# Altium schematic sheet Calendar.SchDoc: =DT_SCH_Title
size A4; Organization: Droid Technologies; SheetNumber: 18; SheetTotal: 22
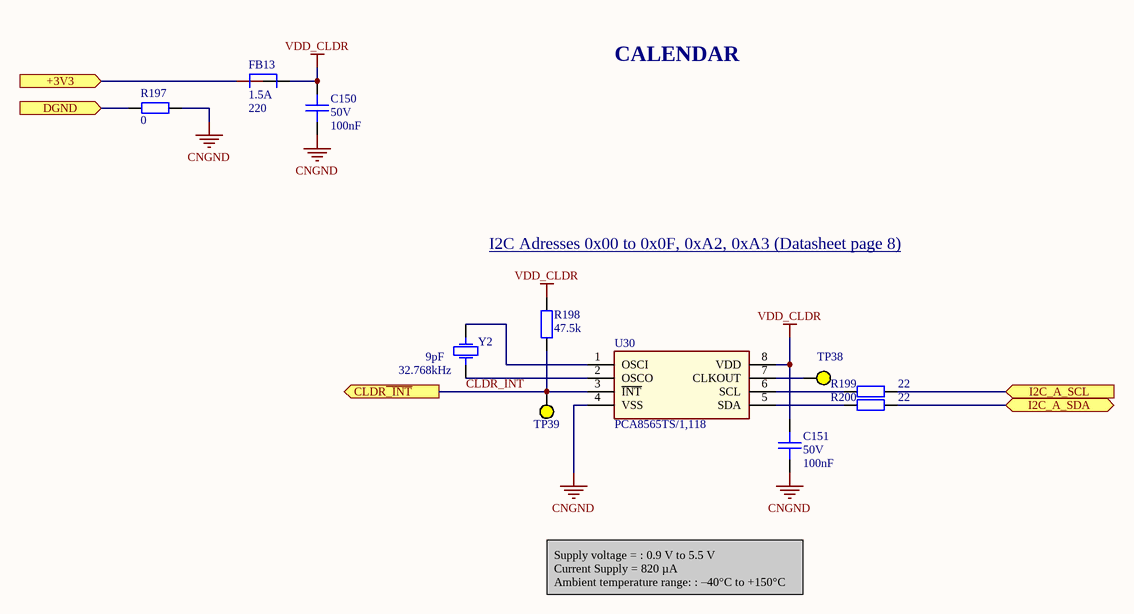
[diagram p0: Calendar.SchDoc]

## Parts
C150  Voltage Rating: 50V  Capacitance: 100nF  [CAPC100x50x50L25]  (hidden comment: GCM155L8EH104KE07D)
C151  Voltage Rating: 50V  Capacitance: 100nF  [CAPC100x50x50L25]  (hidden comment: GCM155L8EH104KE07D)
FB13  Imax: 1.5A  Impedance: 220  [BEADC160X80X95L40]  (hidden comment: BLM18KG221BH1D)
R197  Resistance: 0  [RESC160X80X55L30]  (hidden comment: RC0603FR-070RL)
R198  Resistance: 47.5k  [RESC100X50X40L25]  (hidden comment: RC0402FR-0747K5L)
R199  Resistance: 22  [RESC100X50X40L25]  (hidden comment: RC0402FR-0722RL)
R200  Resistance: 22  [RESC100X50X40L25]  (hidden comment: RC0402FR-0722RL)
TP38  Test Point  [TP_D0.75mm]  (value not drawn)  (no BOM)
TP39  Test Point  [TP_D0.75mm]  (value not drawn)  (no BOM)
U30  PCA8565TS/1,118  [MINISOIC-8]
Y2  C load: 9pF  F: 32.768kHz  [XTALDFN2_320X150X85L75X150]  (hidden comment: ABS07AIG-32.768KHZ-9-1-T)

## Ports
+3V3 (in), CLDR~{_INT} (out), DGND (in), I2C_A_SCL (in), I2C_A_SDA (bidir)

## Nets
CNGND: C150.1 C151.1 R197.1 U30.4(VSS)
VDD_CLDR: C150.2 C151.2 FB13.2 R198.2 U30.8(VDD)
+3V3: FB13.1 ; port +3V3
CLDR~{_INT}: R198.1 TP39.1 U30.3(~{INT}) ; port CLDR~{_INT}
DGND: R197.2 ; port DGND
I2C_A_SCL: R199.2 ; port I2C_A_SCL
I2C_A_SDA: R200.2 ; port I2C_A_SDA
NetR199_1: R199.1 U30.6(SCL)
NetR200_1: R200.1 U30.5(SDA)
NetTP38_1: TP38.1 U30.7(CLKOUT)
NetU30_1: U30.1(OSCI) Y2.1
NetU30_2: U30.2(OSCO) Y2.2

## Notes on the sheet
- CALENDAR
- I2C Adresses 0x00 to 0x0F, 0xA2, 0xA3 (Datasheet page 8) <https://www.nxp.com/docs/en/data-sheet/PCA8565.pdf>
- Supply voltage = : 0.9 V to 5.5 V
  Current Supply = 820 µA
  Ambient temperature range: : –40°C to +150°C
- Title
- Size:
- A4
- Number:
- Revision:
- Date:
- Time:
- Sheet
- of

## Library data of the parts
C150 C151 = CMP-001-1980-2: CAP CER 0.1UF 50V X8L 0402; Manufacturer: Murata Electronics; Op Temp max: 150°C; Op Temp min: -55°C; Tolerance: 10%; Height max: 550µm; ComponentLink3Description: Digikey; Mounting Type: SM; ComponentLink3URL: https://www.digikey.com/en/products/detail/murata-electronics/GCM155L8EH104KE07D/11618823; Package: 0402 (1005 Metric); Lead Spacing: 0mm; MPN: GCM155L8EH104KE07D; Size: 1.00mm x 0.50mm; Ratings: AEC-Q200; ComponentLink1URL: https://www.murata.com/en-us/products/productdetail?partno=GCM155L8EH104KE07%23; ComponentLink1Description: Datasheet; Dielectric: X8L; ComponentLink2Description: Mouser; ComponentLink2URL: https://eu.mouser.com/ProductDetail/Murata-Electronics/GCM155L8EH104KE07D?qs=1mbolxNpo8fQSHf0HYnZWw%3D%3D
FB13 = CMP-001-1981-1: FERRITE BEAD 220 OHM 0603 1LN; Manufacturer: Murata Electronics; DCR: 50m; Op Temp min: -55°C; Frequency: 100MHz; Op Temp max: 150°C; Number of Lines: 1; Mounting Type: SM; Size: 1.60mm x 0.80mm; ComponentLink2URL: https://eu.mouser.com/ProductDetail/Murata-Electronics/BLM18KG221BH1D?qs=sJ5gq5MLFXpgEHYBdWUtkQ%3D%3D; ComponentLink1Description: Datasheet; ComponentLink1URL: https://www.murata.com/en-us/products/productdata/8798137286686/QNFA9129.pdf; Lead Spacing: 0mm; Ratings: AEC-Q200; ComponentLink3Description: Digikey; ComponentLink3URL: https://www.digikey.com/en/products/detail/murata-electronics/BLM18KG221BH1D/6156000; Height max: 950µm; Package: 0603 (1608 Metric); ComponentLink2Description: Mouser; MPN: BLM18KG221BH1D
R197 = CMP-001-0927-2: RES 0 OHM JUMPER 1/10W 0603; Manufacturer: YAGEO; Op Temp min: -55°C; Op Temp max: 155°C; Power: 100mW; Tolerance: 0%; Height max: 550µm; ComponentLink2URL: https://eu.mouser.com/ProductDetail/YAGEO/RC0603FR-070RL?qs=0yPvnVz5%2FmpDQv43TwvCfw%3D%3D; Temperature Coefficient: -; ComponentLink3Description: Digikey; ComponentLink2Description: Mouser; MPN: RC0603FR-070RL; ComponentLink1URL: https://www.yageo.com/upload/media/product/productsearch/datasheet/rchip/PYu-RC_Group_51_RoHS_L_12.pdf; Ratings: -; Size: 1.60mm x 0.80mm; Composition: Thick Film; Mounting Type: SM; ComponentLink3URL: https://www.digikey.com/en/products/detail/yageo/RC0603FR-070RL/1304008; Package: 0603 (1608 Metric); ComponentLink1Description: Datasheet
R198 = CMP-001-0277-7: RES 47.5K OHM 1% 1/16W 0402; Manufacturer: YAGEO; Op Temp min: -55°C; Power: 63mW; Temperature Coefficient: ±100ppm; Op Temp max: 155°C; ComponentLink1URL: https://www.yageo.com/upload/media/product/productsearch/datasheet/rchip/PYu-RC_Group_51_RoHS_L_12.pdf; ComponentLink1Description: Datasheet; MPN: RC0402FR-0747K5L; ComponentLink3Description: Digikey; ComponentLink2URL: https://eu.mouser.com/ProductDetail/YAGEO/RC0402FR-0747K5L?qs=V1yeUXFNrklfu86Rfgihxg%3D%3D; Mounting Type: SM; Tolerance: 1%; Package: 0402 (1005 Metric); Height max: 400µm; ComponentLink2Description: Mouser; ComponentLink3URL: https://www.digikey.com/en/products/detail/yageo/RC0402FR-0747K5L/726617; Size: 1.00mm x 0.50mm; Composition: Thick Film; Ratings: -
R199 R200 = CMP-001-0482-4: RES 22 OHM 1% 1/16W 0402; Manufacturer: YAGEO; Temperature Coefficient: ±100ppm; Op Temp max: 155°C; Op Temp min: -55°C; Power: 63mW; Ratings: -; ComponentLink3URL: https://www.digikey.com/en/products/detail/yageo/RC0402FR-0722RL/726562; ComponentLink2URL: https://eu.mouser.com/ProductDetail/YAGEO/RC0402FR-0722RL?qs=V1yeUXFNrkkRg6zf08ADKQ%3D%3D; MPN: RC0402FR-0722RL; ComponentLink1Description: Datasheet; ComponentLink3Description: Digikey; Tolerance: 1%; Size: 1.00mm x 0.50mm; ComponentLink1URL: https://www.yageo.com/upload/media/product/productsearch/datasheet/rchip/PYu-RC_Group_51_RoHS_L_12.pdf; Composition: Thick Film; ComponentLink2Description: Mouser; Mounting Type: SM; Package: 0402 (1005 Metric); Height max: 400µm
TP38 TP39 = TP_0.75: Test point 0.75mm
U30 = PCA8565TS/1,118: IC RTC CLK/CALENDAR I2C 8TSSOP; Manufacturer: NXP USA Inc.; MPN: PCA8565TS/1,118
Y2 = CMP-001-1983-1: CRYSTAL 32.7680KHZ 9PF SMD; Manufacturer: Abracon LLC; ESR: 80k; Op Temp max: 125°C; Op Temp min: -40°C; F Tolerance: ±10ppm; Height max: 900µm; ComponentLink2Description: Mouser; Mounting Type: SM; ComponentLink3Description: Digikey; MPN: ABS07AIG-32.768KHZ-9-1-T; ComponentLink1URL: https://abracon.com/datasheets/ABS07AIG.pdf; ComponentLink2URL: https://eu.mouser.com/ProductDetail/ABRACON/ABS07AIG-32.768KHZ-9-1-T?qs=gG6m684uYP5Ouz7KwhjT2A%3D%3D; ComponentLink1Description: Datasheet; Size: 3.20mm x 1.50mm; ComponentLink3URL: https://www.digikey.com/en/products/detail/abracon-llc/ABS07AIG-32-768KHZ-9-1-T/5817553; Package: 2-SMD, No Lead; F Stability: -; Ratings: AEC-Q200